# Altium project nicenano_m666.PrjPcb
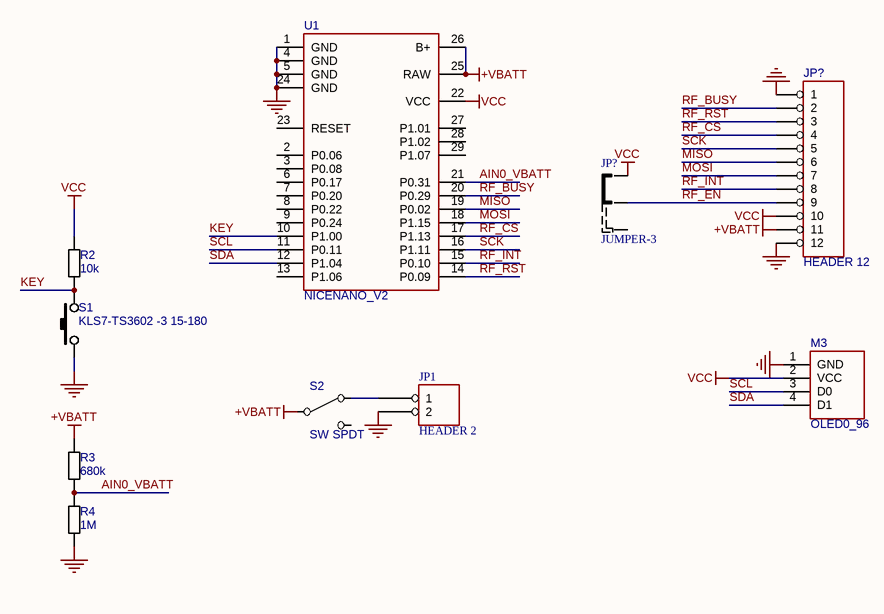
[diagram p0: nicenano_m666.SchDoc]
1 sheet, 10 parts. Net scope: global (net labels, ports and power ports of the same name join across sheets).

## Sheet nicenano_m666.SchDoc
size A3; SheetNumber: 1; SheetTotal: 1

### Parts
(Parts that share a designator on the sheet are numbered #1, #2 ... from top to bottom, then left to right.)
JP1  HEADER 2  [PLS1-2]
JP?#1  HEADER 12  [PLS1-12R_1]
JP?#2  JUMPER-3  [JMP3]
M3  OLED0_96  [OLED096_I2C]
R2  10k  [R-0603]
R3  680k  [R-0603]
R4  1M  [R-0603]
S1  KLS7-TS3602 -3 15-180  [BUTT_MIN]
S2  SW SPDT  [SK-12D07VG5]
U1  NICENANO_V2  [NICENANO_SMD]

### Nets
+VBATT: JP?#1.11 R3.2 S2.2(COMMON) U1.25(RAW) U1.26(B+)
GND: JP1.2 JP?#1.1 JP?#1.12 M3.1(GND) R4.1 S1.1 U1.1(GND) U1.4(GND) U1.5(GND) U1.24(GND)
VCC: JP?#1.10 JP?#2.1 M3.2(VCC) R2.1 U1.22(VCC)
AIN0_VBATT: R3.1 R4.2 U1.21(P0.31)
KEY: R2.2 S1.2 U1.10(P1.00)
MISO: JP?#1.6 U1.19(P0.02)
MOSI: JP?#1.7 U1.18(P1.15)
RF_BUSY: JP?#1.2 U1.20(P0.29)
RF_CS: JP?#1.4 U1.17(P1.13)
RF_EN: JP?#1.9 JP?#2.2
RF_INT: JP?#1.8 U1.15(P0.10)
RF_RST: JP?#1.3 U1.14(P0.09)
SCK: JP?#1.5 U1.16(P1.11)
SCL: M3.3(D0) U1.11(P0.11)
SDA: M3.4(D1) U1.12(P1.04)
NetJP1_1: JP1.1 S2.1(NC)

Not connected (* = marked no-connect by the designer): JP?#2 3; S2 3(NO); U1 2(P0.06) 3(P0.08) 6(P0.17) 7(P0.20) 8(P0.22) 9(P0.24) 13(P1.06) 23(RESET) 27(P1.01) 28(P1.02) 29(P1.07)

### Library data of the parts
JP1 = HEADER 2: Вид: Роз'єм; *: *
JP?#1 = HEADER 12: Вид: Роз'єм; *: *
JP?#2 = JUMPER-3: Jumper; Вид: Роз'єм; *: *
M3 = OLED0_96_I2C
R2-R4 = RES: Точність/група: 5%; Вид: Резистор
S1 = SW-1: Вид: Кнопка; Робоча напруга: *
S2 = SW SPDT: Вид: Перемикач; Виробник: *; *: *
U1 = NICENANO_V2: Вид: Мікросхема